# Altium schematic sheet PneuBoardSchematic.SchDoc
size A4
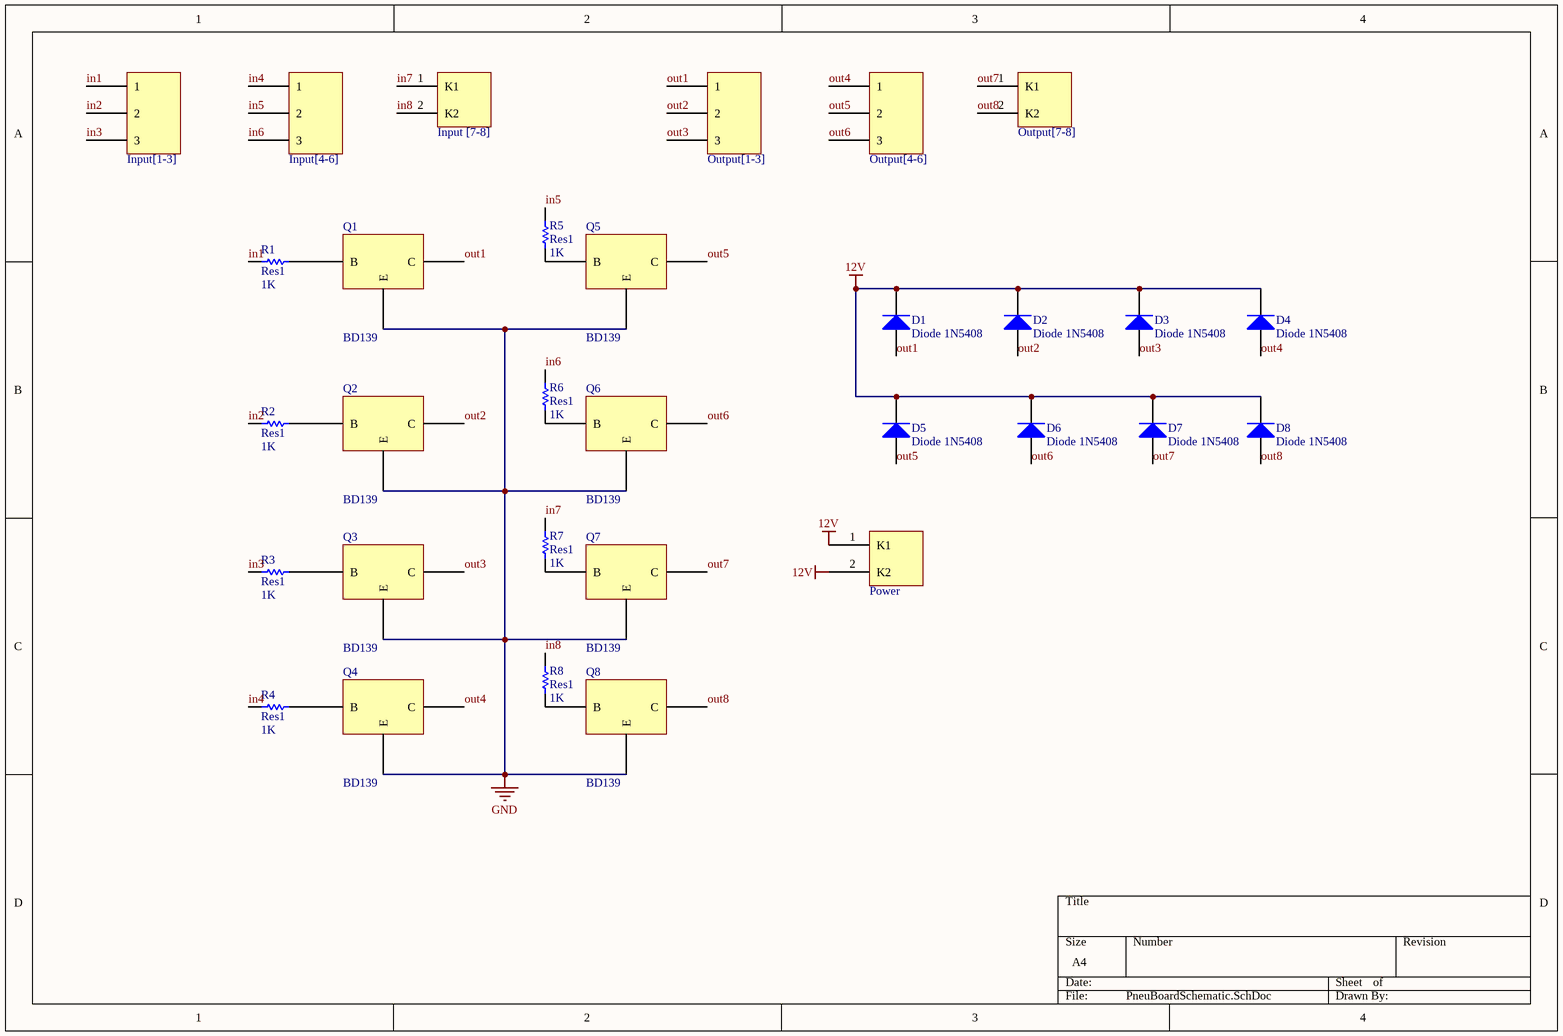
[diagram p0: PneuBoardSchematic.SchDoc]

## Parts
D1  Diode 1N5408  [DO-201AD]
D2  Diode 1N5408  [DO-201AD]
D3  Diode 1N5408  [DO-201AD]
D4  Diode 1N5408  [DO-201AD]
D5  Diode 1N5408  [DO-201AD]
D6  Diode 1N5408  [DO-201AD]
D7  Diode 1N5408  [DO-201AD]
D8  Diode 1N5408  [DO-201AD]
Input[1-3]  klema  [klema3]  (value not drawn)
Input[4-6]  klema  [klema3]  (value not drawn)
Input_[7-8]  Klema  [Klema]  (value not drawn)
Output[1-3]  klema  [klema3]  (value not drawn)
Output[4-6]  klema  [klema3]  (value not drawn)
Output[7-8]  Klema  [Klema]  (value not drawn)
Power  Klema  [Klema]  (value not drawn)
Q1  BD139  [BD139]
Q2  BD139  [BD139]
Q3  BD139  [BD139]
Q4  BD139  [BD139]
Q5  BD139  [BD139]
Q6  BD139  [BD139]
Q7  BD139  [BD139]
Q8  BD139  [BD139]
R1  Res1  value 1K  [AXIAL-0.3]
R2  Res1  value 1K  [AXIAL-0.3]
R3  Res1  value 1K  [AXIAL-0.3]
R4  Res1  value 1K  [AXIAL-0.3]
R5  Res1  value 1K  [AXIAL-0.3]
R6  Res1  value 1K  [AXIAL-0.3]
R7  Res1  value 1K  [AXIAL-0.3]
R8  Res1  value 1K  [AXIAL-0.3]

## Nets
12V: D1.2(K) D2.2(K) D3.2(K) D4.2(K) D5.2(K) D6.2(K) D7.2(K) D8.2(K) Power.1(K1) Power.2(K2)
GND: Q1.1(E) Q2.1(E) Q3.1(E) Q4.1(E) Q5.1(E) Q6.1(E) Q7.1(E) Q8.1(E)
in1: Input[1-3].1 R1.1
in2: Input[1-3].2 R2.1
in3: Input[1-3].3 R3.1
in4: Input[4-6].1 R4.1
in5: Input[4-6].2 R5.2
in6: Input[4-6].3 R6.2
in7: Input_[7-8].1(K1) R7.2
in8: Input_[7-8].2(K2) R8.2
out1: D1.1(A) Output[1-3].1 Q1.2(C)
out2: D2.1(A) Output[1-3].2 Q2.2(C)
out3: D3.1(A) Output[1-3].3 Q3.2(C)
out4: D4.1(A) Output[4-6].1 Q4.2(C)
out5: D5.1(A) Output[4-6].2 Q5.2(C)
out6: D6.1(A) Output[4-6].3 Q6.2(C)
out7: D7.1(A) Output[7-8].1(K1) Q7.2(C)
out8: D8.1(A) Output[7-8].2(K2) Q8.2(C)
NetQ1_3: Q1.3(B) R1.2
NetQ2_3: Q2.3(B) R2.2
NetQ3_3: Q3.3(B) R3.2
NetQ4_3: Q4.3(B) R4.2
NetQ5_3: Q5.3(B) R5.1
NetQ6_3: Q6.3(B) R6.1
NetQ7_3: Q7.3(B) R7.1
NetQ8_3: Q8.3(B) R8.1

## Library data of the parts
D1-D8 = Diode 1N5408: 3 Amp Medium Power Silicon Rectifier Diode; Published: 8-Jun-2000; LatestRevisionDate: 17-Jul-2002; LatestRevisionNote: Re-released for DXP Platform.; DatasheetVersion: Aug-1984; PackageReference: DO-201AD; Publisher: Altium Limited; PackageDescription: Diode, Axial; Body 9.5 x 5.3 mm (LxDia. max), Lead Dia. 1.32 mm (max); ComponentLink1Description: Manufacturer Link; ComponentLink1URL: http://www.irf.com/
Input[1-3] Input[4-6] Output[1-3] Output[4-6] = klema3
R1-R8 = Res1: Resistor; Published: 8-Jun-2000; LatestRevisionDate: 17-Jul-2002; LatestRevisionNote: Re-released for DXP Platform.; PackageReference: AXIAL-0.3; Publisher: Altium Limited; PackageDescription: Axial Device, Thru-Hole; 2 Leads; 0.3 in Pin Spacing